# Altium schematic sheet VFD-Support-Sheet2.SchDoc
size 420 x 297 mm; SheetNumber: 14; SheetTotal: 15
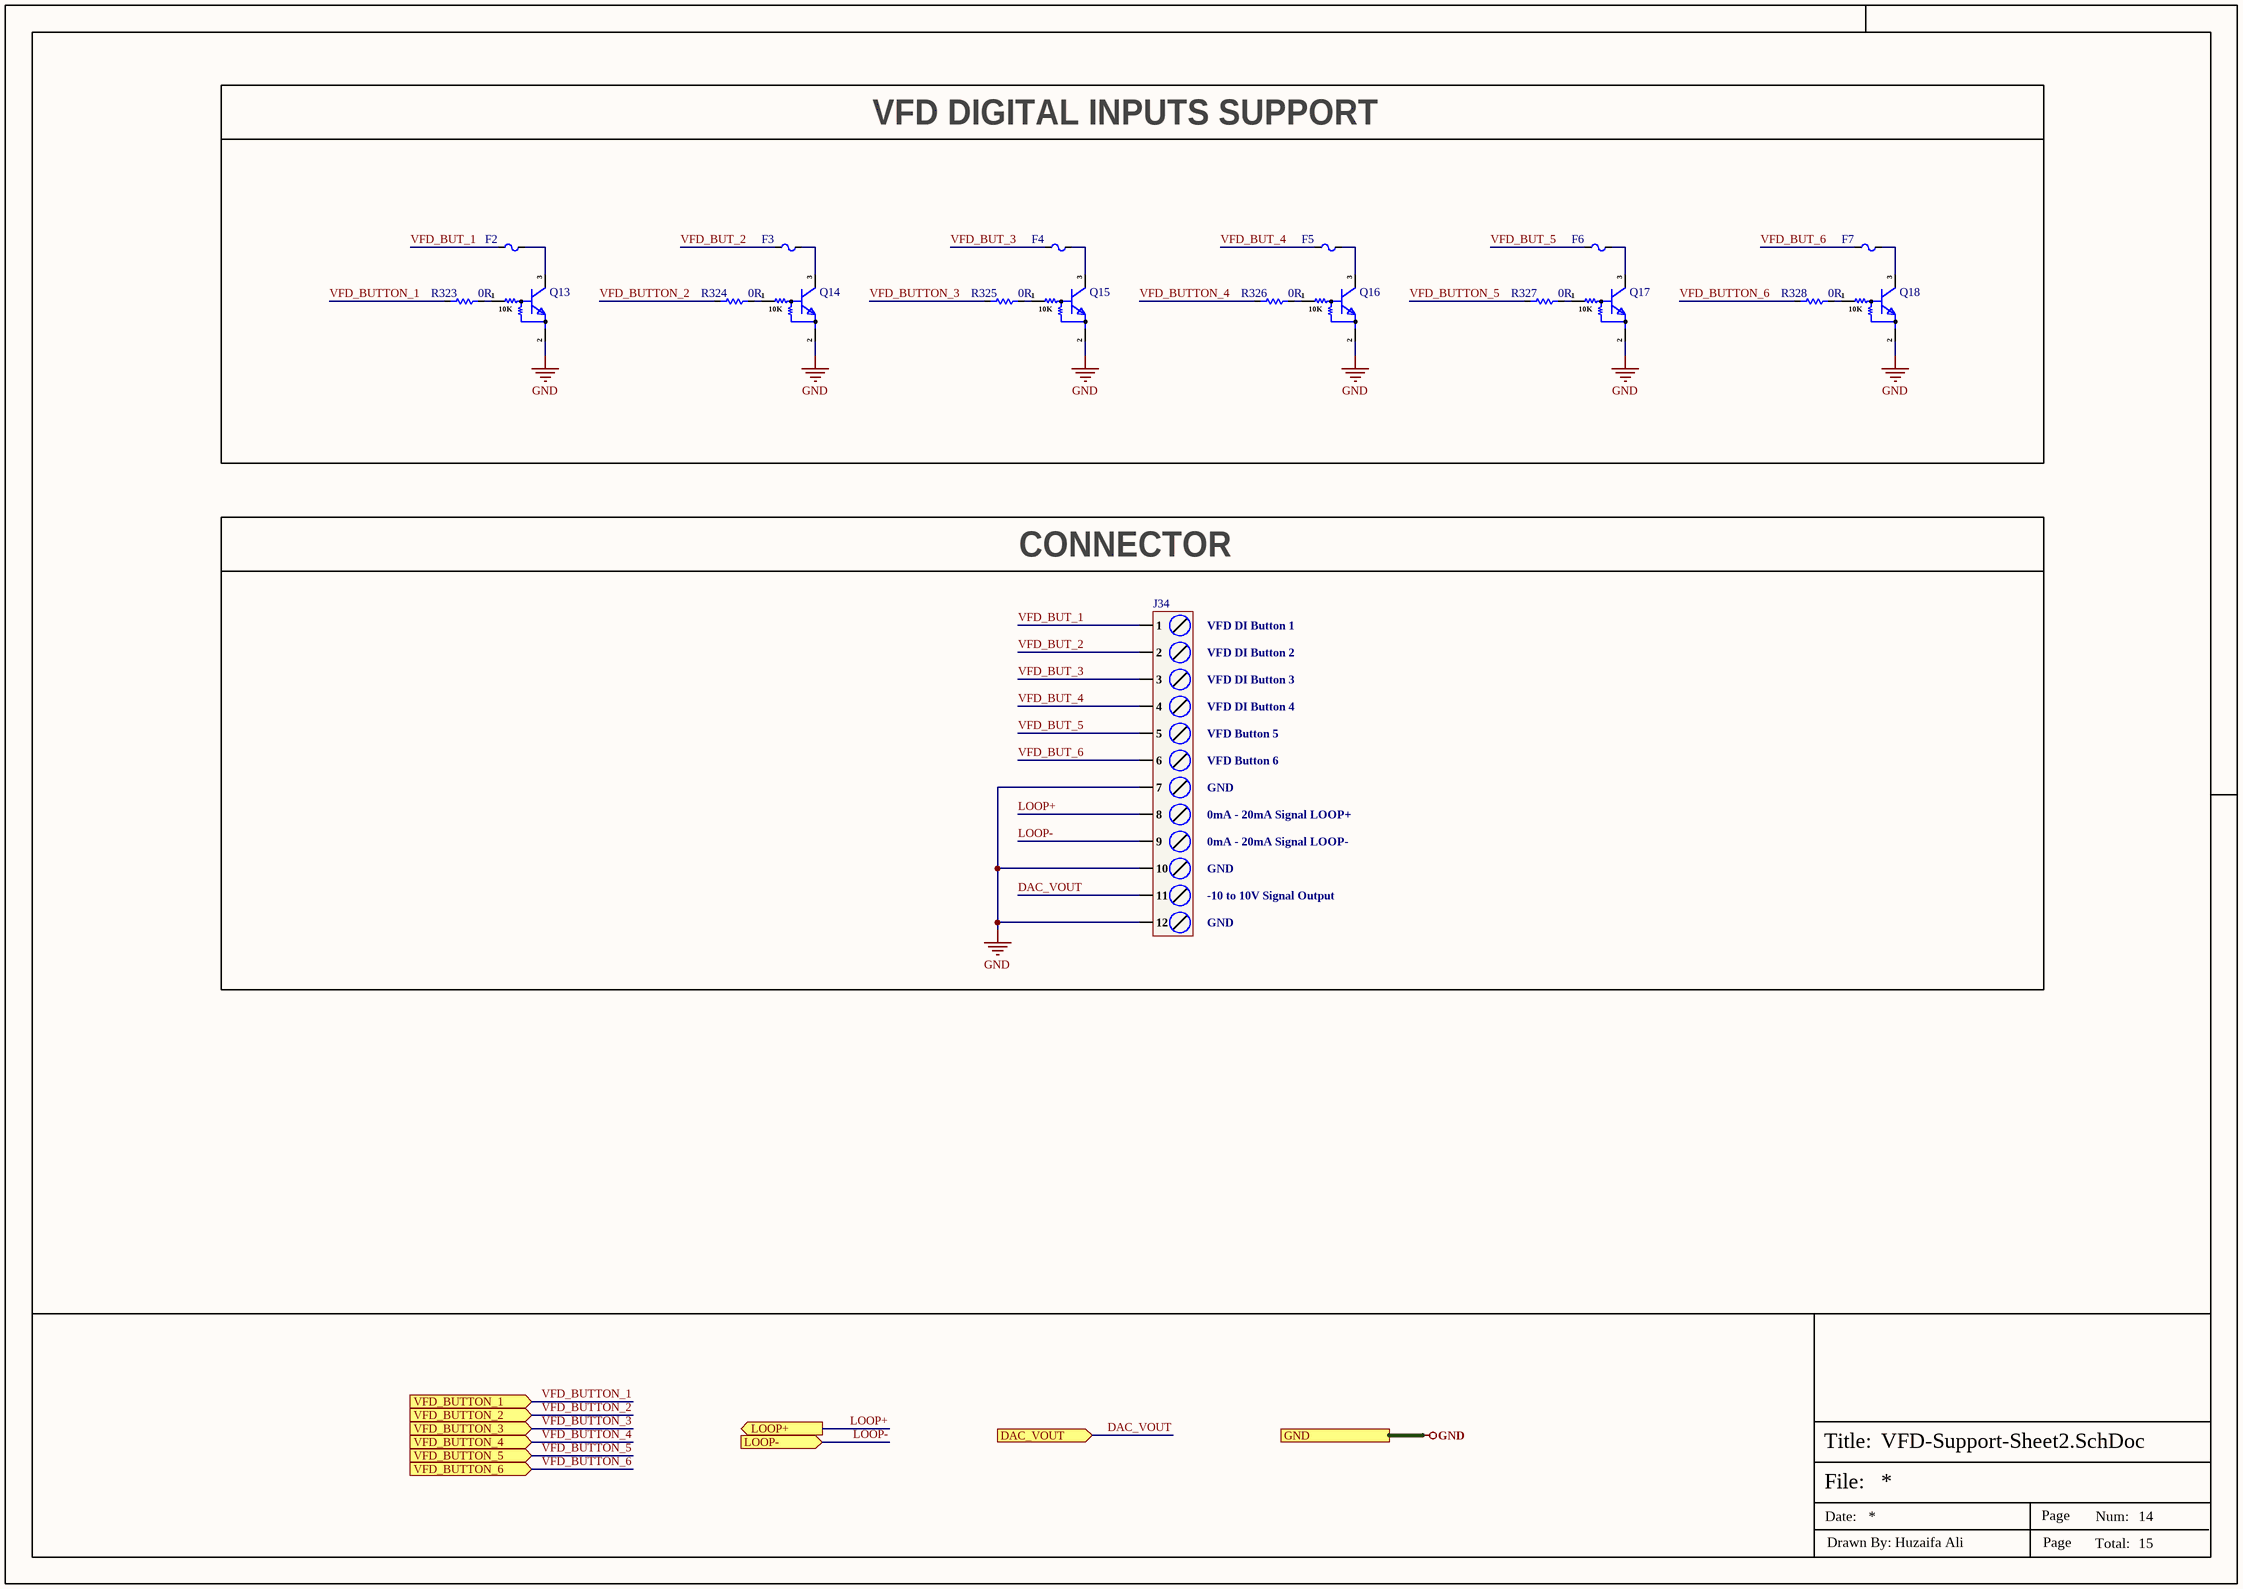
[diagram p0: VFD-Support-Sheet2.SchDoc]

## Parts
F2  SMD0603-003/30N  [Fuse-0603]  (value not drawn)
F3  SMD0603-003/30N  [Fuse-0603]  (value not drawn)
F4  SMD0603-003/30N  [Fuse-0603]  (value not drawn)
F5  SMD0603-003/30N  [Fuse-0603]  (value not drawn)
F6  SMD0603-003/30N  [Fuse-0603]  (value not drawn)
F7  SMD0603-003/30N  [Fuse-0603]  (value not drawn)
J34  JL301-50012U01  [JL301-50012U01]  (value not drawn)
Q13  LMUN2211LT1G  [SOT-23]  (value not drawn)
Q14  LMUN2211LT1G  [SOT-23]  (value not drawn)
Q15  LMUN2211LT1G  [SOT-23]  (value not drawn)
Q16  LMUN2211LT1G  [SOT-23]  (value not drawn)
Q17  LMUN2211LT1G  [SOT-23]  (value not drawn)
Q18  LMUN2211LT1G  [SOT-23]  (value not drawn)
R323  0R  [Res-0402]
R324  0R  [Res-0402]
R325  0R  [Res-0402]
R326  0R  [Res-0402]
R327  0R  [Res-0402]
R328  0R  [Res-0402]

## Blocks framed on the sheet
VFD DIGITAL INPUTS SUPPORT: F2-F7 Q13-Q18 R323-R328
CONNECTOR: J34

## Ports
DAC_VOUT (in, see Top-Sheet[5D], VFD-Support-Sheet[4D]), GND (see Top-Sheet[5C], Buttons-Lights-Sensors-Sheet[4D], CAN-Sheet[6D], Controller-Sheet-1[4D], Controller-Sheet-2[4D], Controller-Sheet-3[4D], EtherCAT-Sheet[1D], Ethernet-PHY-Sheet[4D], Extra-DIOs[4D], Power-Sheet[4D], RS232-Sheet[5D], RS485-Sheet[5D], USB-Sheet[4D], VFD-Support-Sheet[4D]), LOOP+ (out, see Top-Sheet[5D], VFD-Support-Sheet[3D]), LOOP- (in, see Top-Sheet[5D], VFD-Support-Sheet[3D]), VFD_BUTTON_1 (in, see Top-Sheet[5C]), VFD_BUTTON_2 (in, see Top-Sheet[5C]), VFD_BUTTON_3 (in, see Top-Sheet[5C]), VFD_BUTTON_4 (in, see Top-Sheet[5C]), VFD_BUTTON_5 (in, see Top-Sheet[5D]), VFD_BUTTON_6 (in, see Top-Sheet[5D])

## Nets
GND: J34.7 J34.10 J34.12 Q13.2(E) Q14.2(E) Q15.2(E) Q16.2(E) Q17.2(E) Q18.2(E) ; port GND
DAC_VOUT: J34.11 ; port DAC_VOUT
LOOP+: J34.8 ; port LOOP+
LOOP-: J34.9 ; port LOOP-
VFD_BUT_1: F2.1 J34.1
VFD_BUT_2: F3.1 J34.2
VFD_BUT_3: F4.1 J34.3
VFD_BUT_4: F5.1 J34.4
VFD_BUT_5: F6.1 J34.5
VFD_BUT_6: F7.1 J34.6
VFD_BUTTON_1: R323.2 ; port VFD_BUTTON_1
VFD_BUTTON_2: R324.2 ; port VFD_BUTTON_2
VFD_BUTTON_3: R325.2 ; port VFD_BUTTON_3
VFD_BUTTON_4: R326.2 ; port VFD_BUTTON_4
VFD_BUTTON_5: R327.2 ; port VFD_BUTTON_5
VFD_BUTTON_6: R328.2 ; port VFD_BUTTON_6
NetF2_2: F2.2 Q13.3(C)
NetF3_2: F3.2 Q14.3(C)
NetF4_2: F4.2 Q15.3(C)
NetF5_2: F5.2 Q16.3(C)
NetF6_2: F6.2 Q17.3(C)
NetF7_2: F7.2 Q18.3(C)
NetQ13_1: Q13.1(B) R323.1
NetQ14_1: Q14.1(B) R324.1
NetQ15_1: Q15.1(B) R325.1
NetQ16_1: Q16.1(B) R326.1
NetQ17_1: Q17.1(B) R327.1
NetQ18_1: Q18.1(B) R328.1

## Notes on the sheet
- VFD DI Button 1
- VFD DI Button 2
- VFD DI Button 3
- VFD DI Button 4
- VFD Button 5
- GND
- VFD Button 6
- 0mA - 20mA Signal LOOP+
- 0mA - 20mA Signal LOOP-
- -10 to 10V Signal Output
- File:
- Title:
- Date:
- Page
- Num:
- Total:
- Drawn By: Huzaifa Ali
- (in symbol LMUN2211LT1G) 10K

## Library data of the parts
F2-F7 = SMD0603-003/30N: 30V 30mA 20A 90mA 0603 Resettable Fuses ROHS; Manufacturer: BHFUSE; Supplier: LCSC; LCSC Part Number: C2687870; Manufacturer Part Number: SMD0603-003/30N; RoHS: No; ComponentLink1Description: LCSC; ComponentLink1URL: https://www.lcsc.com/product-detail/Resettable-Fuses_BORN-SMD0603-003-30N_C2687870.html
J34 = JL301-50012U01: 1x12P -40℃~+105℃ 15A 300V Blue 12~24 Direct Insert 5mm 1 12 Plugin,P=5mm Screw Terminal Blocks ROHS; Manufacturer: JILN; Manufacturer Part Number: JL301-50012U01; Package: Plugin,P=5mm; LCSC Part Number: C1509686; Item Type: Screw Terminal; ComponentLink1Description: LCSC; ComponentLink1URL: https://www.lcsc.com/product-detail/Screw-Terminal-Blocks_JILN-JL301-50012U01_C1509686.html
Q13-Q18 = LMUN2211LT1G: NPN 246mW 100mA 50V SOT-23 Digital Transistors ROHS; Manufacturer: LRC; Item Type: Mosfet; Manufacturer Part Number: LMUN2211LT1G; Package: SOT-23; LCSC Part Number: C12775; ComponentLink1Description: LCSC; ComponentLink1URL: https://www.lcsc.com/product-detail/Digital-Transistors_LRC-LMUN2211LT1G_C12775.html
R323-R328 = RC0402FR-070RL: RES 0 OHM JUMPER 1/16W 0402; Manufacturer: Yageo; Item Type: Resistors; Tolerance: 1%; Power Rating: 62.5mW; Voltage Rating: 50V; Temperature Coefficient: 200ppm/°C; Max Power Dissipation: 63mW; Supplier 1: Mouser; Manufacturer Part Number: RC0402FR-070RL; RoHS: Yes; Stock 1: 8556842; Pricing 1: 1=0.10000, 10=0.01400, 50=0.01400, 100=0.00600, 1000=0.00300, 5000=0.00200, 10000=0.00100 (USD); Mount: Surface Mount; Case/Package: 0402; Contact Plating: Tin,Matte; Case Code (Imperial): 0402; Case Code (Metric): 1005; Size Code: 0402; Min Operating Temperature: -55°C; Max Operating Temperature: 155°C; Resistance: 0R; Resistor Type: Thick Film; Packaging: Tape and Reel; Termination: SMD/SMT; Features: Moisture Resistant; Series: RC; Number of Terminations: 2; Length: 1mm; Width: 0.5mm; Height: 0.35mm; Radiation Hardening: No; Lead Free: Lead Free; RoHS Compliant: Yes; ComponentLink1URL: https://datasheet.ciiva.com/8896/pyu-rc0402-51-rohs-l-6-8896149.pdf?src-supplier=Avnet; ComponentLink1Description: https://datasheet.ciiva.com/8896/pyu-rc0402-51-rohs-l-6-8896149.pdf?src-supplier=Avnet; ComponentLink2URL: https://datasheet.ciiva.com/16790/pyu-rc0402-51-rohs-l-6-r-16790444.pdf?src-supplier=Future+Electronics; ComponentLink2Description: https://datasheet.ciiva.com/16790/pyu-rc0402-51-rohs-l-6-r-16790444.pdf?src-supplier=Future+Electronics; Supplier Part Number 1: 603-RC0402FR-070RL; LCSC Part Number: C106231